# Altium schematic sheet radxa_CM3J_SHEET-1.SchDoc
size A4; SheetNumber: 2; SheetTotal: 10
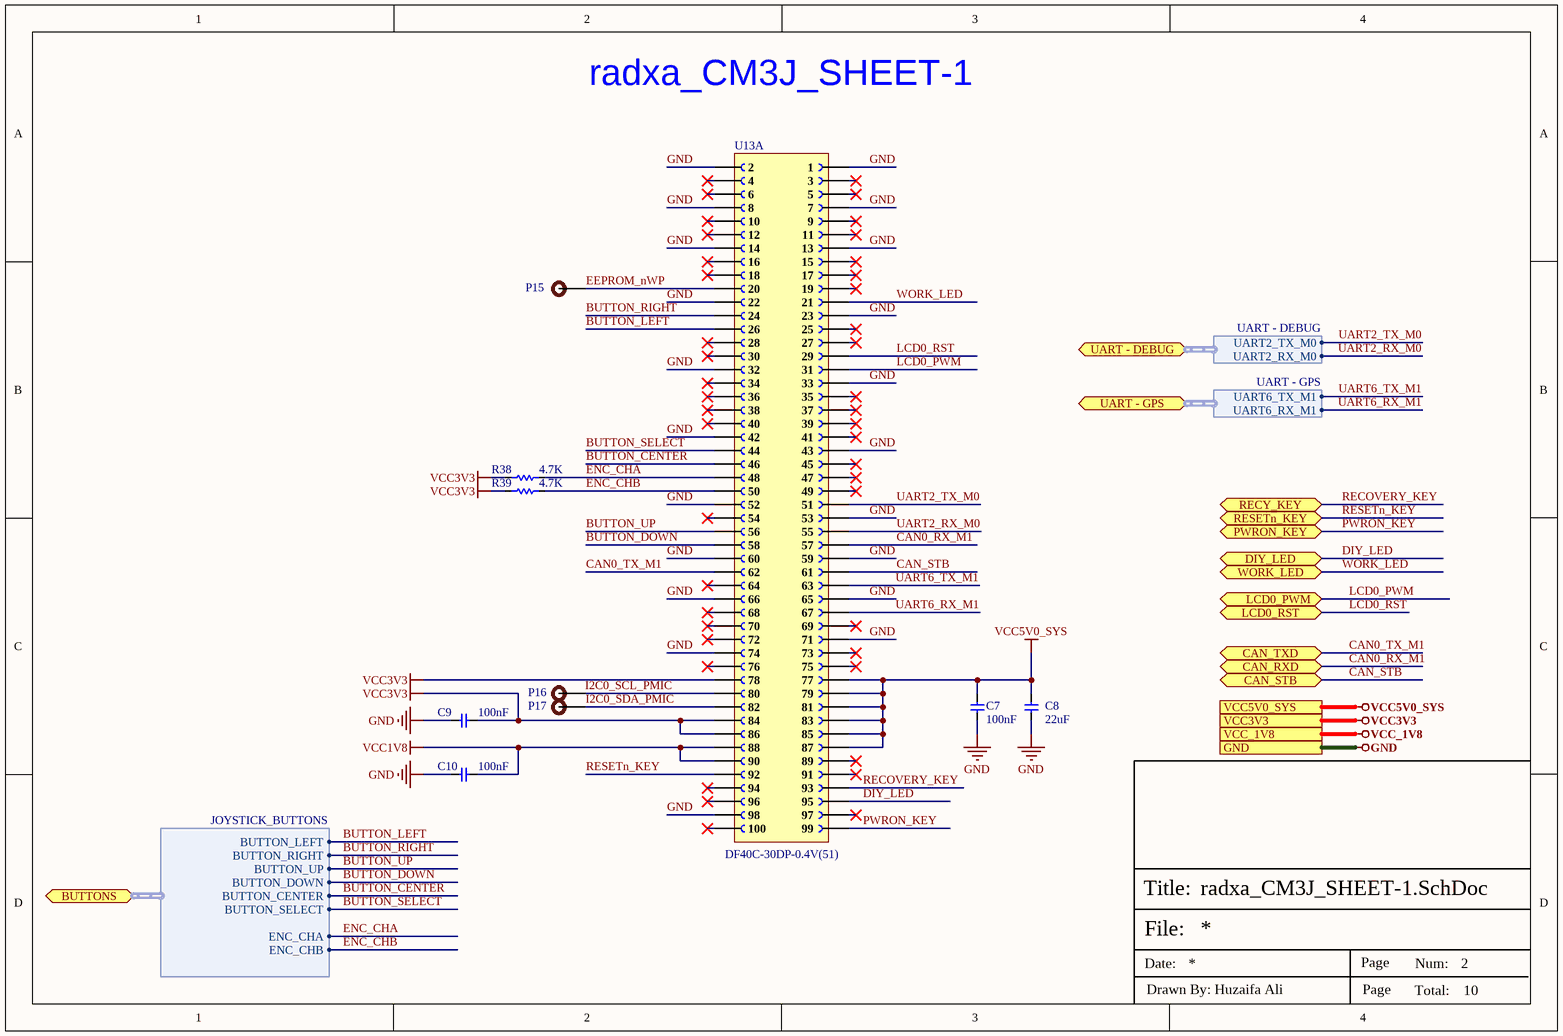
[diagram p0: radxa_CM3J_SHEET-1.SchDoc]

## Parts
C7  100nF  [Cap-0402]
C8  22uF  [Cap-0402]
C9  100nF  [Cap-0402]
C10  100nF  [Cap-0402]
P15  TEST POINT 0.5mm Dia  [Test-point - 0.5mm]  (value not drawn)  (no BOM)
P16  TEST POINT 0.5mm Dia  [Test-point - 0.5mm]  (value not drawn)  (no BOM)
P17  TEST POINT 0.5mm Dia  [Test-point - 0.5mm]  (value not drawn)  (no BOM)
R38  4.7K  [Res-0402]
R39  4.7K  [Res-0402]
U13A  DF40C-30DP-0.4V(51)  [DF40C-100DS-0.4V(51)]

## Ports
BUTTONS (bidir, harness JOYSTICK_BUTTONS, see JOYSTICK_BUTTON_SHEET[2D]), CAN_RXD (bidir, see CAN_SHEET[2D]), CAN_STB (bidir, see CAN_SHEET[2D]), CAN_TXD (bidir, see CAN_SHEET[2D]), DIY_LED (bidir, see MISCELLANEOUS_SHEET[3D]), GND (see CAN_SHEET[3D], GPS_INTERFACE_SHEET[3D], HDMI2.0_SHEET[3D], JOYSTICK_BUTTON_SHEET[3C], MIPI_DISPLAY-SHEET[3D], MISCELLANEOUS_SHEET[3D], POWER_SHEET[3C], radxa_CM3J_SHEET-2[3D], TYPE-C_INTERFACE_SHEET[3D]), LCD0_PWM (bidir, see MIPI_DISPLAY-SHEET[3D]), LCD0_RST (bidir, see MIPI_DISPLAY-SHEET[3D]), PWRON_KEY (bidir, see MISCELLANEOUS_SHEET[3D]), RECY_KEY (bidir, see MISCELLANEOUS_SHEET[3D]), RESETn_KEY (bidir, see MISCELLANEOUS_SHEET[3D]), UART - DEBUG (bidir, harness UART - DEBUG, see MISCELLANEOUS_SHEET[3C]), UART - GPS (bidir, harness UART - GPS, see GPS_INTERFACE_SHEET[1D]), VCC3V3 (see CAN_SHEET[3D], JOYSTICK_BUTTON_SHEET[3C]), VCC5V0_SYS (see CAN_SHEET[3D], HDMI2.0_SHEET[3D], MIPI_DISPLAY-SHEET[3D], POWER_SHEET[3C], TYPE-C_INTERFACE_SHEET[3D]), VCC_1V8, WORK_LED (bidir, see MISCELLANEOUS_SHEET[3D])

## Harnesses
UART - GPS: UART6_TX_M1, UART6_RX_M1
UART - DEBUG: UART2_TX_M0, UART2_RX_M0
JOYSTICK_BUTTONS: BUTTON_LEFT, BUTTON_RIGHT, BUTTON_UP, BUTTON_DOWN, BUTTON_CENTER, BUTTON_SELECT, ENC_CHA, ENC_CHB

## Nets
GND: C7.1 C8.1 C9.1 C10.1 U13A.1 U13A.2 U13A.7 U13A.8 U13A.13 U13A.14 U13A.22 U13A.23 U13A.32 U13A.33 U13A.42 U13A.43 U13A.52 U13A.53 U13A.59 U13A.60 U13A.65 U13A.66 U13A.71 U13A.74 U13A.98 ; port GND
VCC1V8: C10.2 U13A.88 U13A.90
VCC3V3: C9.2 R38.2 R39.2 U13A.78 U13A.84 U13A.86 ; port VCC3V3
VCC5V0_SYS: C7.2 C8.2 U13A.77 U13A.79 U13A.81 U13A.83 U13A.85 U13A.87 ; port VCC5V0_SYS
VCC_1V8: port VCC_1V8
BUTTON_CENTER: U13A.46 ; port BUTTONS.BUTTON_CENTER
BUTTON_DOWN: U13A.58 ; port BUTTONS.BUTTON_DOWN
BUTTON_LEFT: U13A.26 ; port BUTTONS.BUTTON_LEFT
BUTTON_RIGHT: U13A.24 ; port BUTTONS.BUTTON_RIGHT
BUTTON_SELECT: U13A.44 ; port BUTTONS.BUTTON_SELECT
BUTTON_UP: U13A.56 ; port BUTTONS.BUTTON_UP
CAN0_RX_M1: U13A.57 ; port CAN_RXD
CAN0_TX_M1: U13A.62 ; port CAN_TXD
CAN_STB: U13A.61 ; port CAN_STB
DIY_LED: U13A.95 ; port DIY_LED
EEPROM_nWP: P15.1 U13A.20
ENC_CHA: R38.1 U13A.48 ; port BUTTONS.ENC_CHA
ENC_CHB: R39.1 U13A.50 ; port BUTTONS.ENC_CHB
I2C0_SCL_PMIC: P16.1 U13A.80
I2C0_SDA_PMIC: P17.1 U13A.82
LCD0_PWM: U13A.31 ; port LCD0_PWM
LCD0_RST: U13A.29 ; port LCD0_RST
PWRON_KEY: U13A.99 ; port PWRON_KEY
RECOVERY_KEY: U13A.93 ; port RECY_KEY
RESETn_KEY: U13A.92 ; port RESETn_KEY
UART2_RX_M0: U13A.55 ; port UART - DEBUG.UART2_RX_M0
UART2_TX_M0: U13A.51 ; port UART - DEBUG.UART2_TX_M0
UART6_RX_M1: U13A.67 ; port UART - GPS.UART6_RX_M1
UART6_TX_M1: U13A.63 ; port UART - GPS.UART6_TX_M1
WORK_LED: U13A.21 ; port WORK_LED

Not connected (* = marked no-connect by the designer): U13A 3* 4* 5* 6* 9* 10* 11* 12* 15* 16* 17* 18* 19* 25* 27* 28* 30* 34* 35* 36* 37* 38* 39* 40* 41* 45* 47* 49* 54* 64* 68* 69* 70* 72* 73* 75* 76* 89* 91* 94* 96* 97* 100*

## Notes on the sheet
- radxa_CM3J_SHEET-1
- File:
- Title:
- Date:
- Page
- Num:
- Total:
- Drawn By: Huzaifa Ali

## Library data of the parts
C7 C9 C10 = CC0402KRX5R7BB104: CAP CER 0.1UF 16V X5R 0402; Manufacturer: Yageo; Tolerance: 10%; Supplier 1: Mouser; Manufacturer Part Number: CC0402KRX5R7BB104; RoHS: Yes; Category: Ceramic Capacitors; Stock 1: 936792; Pricing 1: 1=0.10000, 10=0.02300, 50=0.02300, 100=0.01100, 1000=0.00600, 10000=0.00400 (USD); Mount: Surface Mount; Case/Package: 0402; Number of Pins: 2; Case Code (Metric): 1005; Case Code (Imperial): 0402; Min Operating Temperature: -55°C; Max Operating Temperature: 85°C; Capacitance: 100nF; Dielectric: X5R; Packaging: Tape and Reel; Voltage Rating: 16V; Package Quantity: 1; Voltage Rating (DC): 16V; Termination: SMD/SMT; Resistor Type: Ceramic; Series: CC; Construction: Flat; Length: 1mm; Width: 0.02inch; Height: 0.5mm; Thickness: 0.022inch; Depth: 0.5mm; Radiation Hardening: No; REACH SVHC: Unknown; Lead Free: Lead Free; Halogen Free: Halogen Free; RoHS Compliant: Yes; ComponentLink1URL: https://datasheet.ciiva.com/155/mlccorderingcode-155879.pdf?src-supplier=Digi-Key; ComponentLink1Description: https://datasheet.ciiva.com/155/mlccorderingcode-155879.pdf?src-supplier=Digi-Key; ComponentLink2URL: https://datasheet.ciiva.com/155/mlccorderingcode-155878.pdf?src-supplier=Digi-Key; ComponentLink2Description: https://datasheet.ciiva.com/155/mlccorderingcode-155878.pdf?src-supplier=Digi-Key; ComponentLink3URL: https://datasheet.ciiva.com/155/mlccorderingcode-155880.pdf?src-supplier=Digi-Key; ComponentLink3Description: https://datasheet.ciiva.com/155/mlccorderingcode-155880.pdf?src-supplier=Digi-Key; ComponentLink4URL: https://datasheet.ciiva.com/11464/upy-gphc-x5r-4v-to-50v-12-11464869.pdf?src-supplier=Avnet; ComponentLink4Description: https://datasheet.ciiva.com/11464/upy-gphc-x5r-4v-to-50v-12-11464869.pdf?src-supplier=Avnet; Supplier Part Number 1: 603-CC402KRX5R7BB104; LCSC Part Number: C106204
C8 = GRM158R61A226ME15D: CAP CER 22UF 10V X5R 0402; Manufacturer: Murata; Item Type: Capacitor; Material: 4241ConductorMaterial; Dielectric: 1537DielectricType; Tolerance: 20%; Manufacturer Part Number: GRM158R61A226ME15D; LCSC Part Number: C3845593; Supplier: Mouser; Supplier Part Number: 81-GRM158R61A226ME5D; RoHS: Yes; Stock: 328944; Pricing: 1=0.46, 10=0.225, 50=0.225, 100=0.146, 1000=0.124, 10000=0.106 (USD); Case/Package: 343Case; Min Operating Temperature: -55°C; Max Operating Temperature: 85°C; Value: 22uF; Voltage Rating: 10V; Voltage Rating (DC): 10V; Length: 1mm; Width: 500um; Height: 800um; Thickness: 800um; Category: Ceramic Capacitors
P15-P17 = TEST POINT 0.5mm Dia: Test Point ON; Item Type: Test Point; Manufacturer Part Number: TEST POINT 0.5mm Dia
R38 R39 = RC0402FR-074K7L: RES 4.7K OHM 1% 1/16W 0402; Manufacturer: Yageo; Voltage Rating (DC): 50V; Power Rating: 62.5mW; Resistance: 4.7kR; Temperature Coefficient: 100ppm/°C; Max Power Dissipation: 63mW; Item Type: Resistor; Supplier 1: Avnet; Manufacturer Part Number: RC0402FR-074K7L; RoHS: Yes; Category: Chip SMD Resistors; Stock 1: 2420000; Pricing 1: 10000=0.00085 (USD); Case/Package: 0402; Number of Pins: 2; Case Code (Imperial): 0402; Case Code (Metric): 1005; Size Code: 0402; Min Operating Temperature: -55°C; Max Operating Temperature: 155°C; Tolerance: 1%; Voltage Rating: 50V; Packaging: Tape and Reel; Resistor Type: Thick Film; Termination: SMD/SMT; Features: Moisture Resistant; Series: RC; Number of Terminations: 2; Resistance Tolerance: 1%; Construction: Rectangular; Length: 1mm; Width: 0.5mm; Height: 0.32mm; Depth: 0.5mm; Height - Seated (Max): 0.016inch; RoHS Compliant: Yes; Reach SVHC Compliant: Yes; Military Standard: Not; Lead Free: Lead Free; ComponentLink1URL: https://datasheet.ciiva.com/22661/1686128-22661342.pdf?src-supplier=Element14; ComponentLink1Description: https://datasheet.ciiva.com/22661/1686128-22661342.pdf?src-supplier=Element14; ComponentLink2URL: https://datasheet.ciiva.com/7850/1018594-7850022.pdf?src-supplier=Element14; ComponentLink2Description: https://datasheet.ciiva.com/7850/1018594-7850022.pdf?src-supplier=Element14; ComponentLink3URL: https://datasheet.ciiva.com/7850/1018594-7850023.pdf?src-supplier=Element14; ComponentLink3Description: https://datasheet.ciiva.com/7850/1018594-7850023.pdf?src-supplier=Element14; ComponentLink4URL: https://datasheet.ciiva.com/15215/getdatasheetpartid-328119-15215035.pdf?src-supplier=Verical; ComponentLink4Description: https://datasheet.ciiva.com/15215/getdatasheetpartid-328119-15215035.pdf?src-supplier=Verical; Supplier Part Number 1: RC0402FR-074K7L; LCSC Part Number: C105871
U13A = DF40C-30DP-0.4V(51): CONN RCPT 100POS SMD GOLD; Manufacturer: Hirose; Item Type: Headers and Wire Housings; Current Rating: 300mA; Voltage Rating: 30V; Connector Type: Plug; Number of Positions: 30; Contact Resistance: 90mR; Pitch: 0.4mm; Mated Stacking Heights: 4mm; Contact Pitch: 400um; Supplier: Future Electronics; LCSC Part Number: C597931; Manufacturer Part Number: DF40C-30DP-0.4V(51); RoHS: Yes; Stock: 10000; Pricing: 5000=0.405 (USD); Mounting Technology: Surface Mount; Contact Plating: Gold; Contact Material: Bronze,Copper Alloy; Housing Material: Polymer; Housing Color: Black; Package Quantity: 5000; Number of Rows: 2; Packaging: Tape and Reel; Termination: SMD/SMT; Number of Contacts: 30; Orientation: Straight; Series: DF40; Contact Voltage Rating (AC): 30V; Contact Voltage Rating (DC): 30V; Reach SVHC Compliant: No; Lead Free: Lead Free; RoHS Compliant: Yes; ComponentLink1URL: https://datasheet.ciiva.com/11746/0900766b80e0bfd2-11746269.pdf?src-supplier=Rs; ComponentLink1Description: https://datasheet.ciiva.com/11746/0900766b80e0bfd2-11746269.pdf?src-supplier=Rs; ComponentLink2URL: https://datasheet.ciiva.com/46408/1824826-46408902.pdf?src-supplier=Element14; ComponentLink2Description: https://datasheet.ciiva.com/46408/1824826-46408902.pdf?src-supplier=Element14